# Altium project Remote_Sensor_Unit-v1.1.PrjPcb (part 1 of 4)
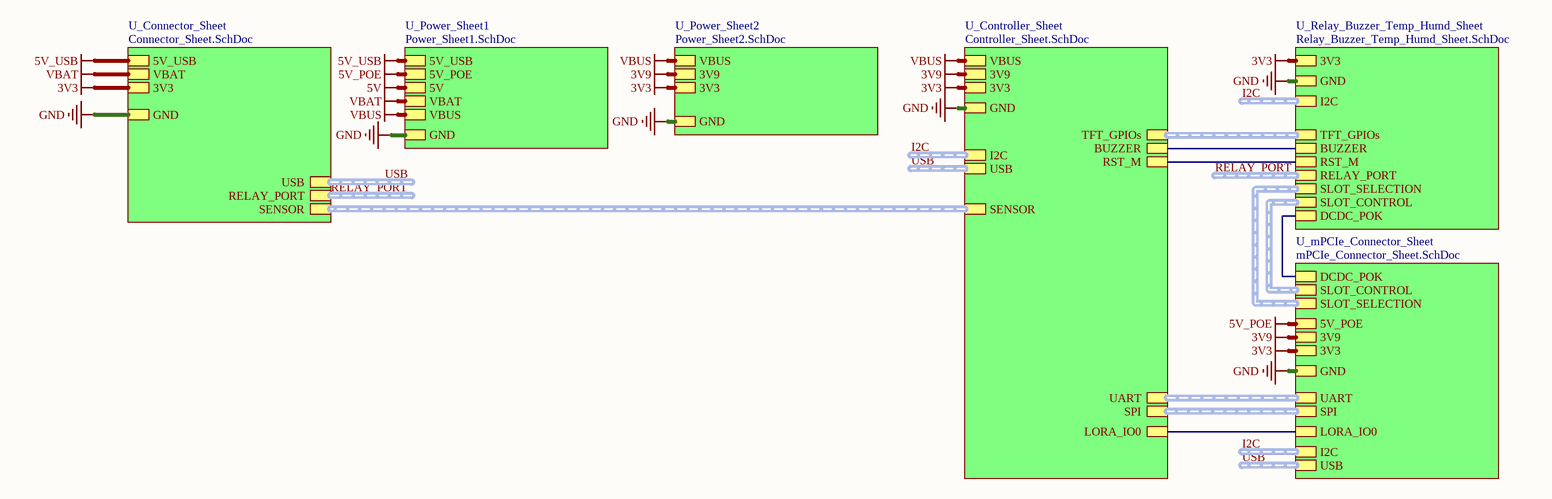
[diagram p0: Top_Sheet.SchDoc]
7 sheets, 164 parts. Net scope: hierarchical (ports join the sheet entries above them; power ports are global).
Board file: RemoteSensorUnit-v1.0.PcbDoc
Sheets:
  Top_Sheet.SchDoc
    U_Connector_Sheet = Connector_Sheet.SchDoc
    U_Power_Sheet1 = Power_Sheet1.SchDoc
    U_Power_Sheet2 = Power_Sheet2.SchDoc
    U_mPCIe_Connector_Sheet = mPCIe_Connector_Sheet.SchDoc
    U_Relay_Buzzer_Temp_Humd_Sheet = Relay_Buzzer_Temp_Humd_Sheet.SchDoc
    U_Controller_Sheet = Controller_Sheet.SchDoc

## Sheet Top_Sheet.SchDoc
size A4; SheetNumber: 1; SheetTotal: 7

### Sub-sheets
U_Connector_Sheet = Connector_Sheet.SchDoc: 5V_USB, 3V3, RELAY_PORT (harness RELAY_PORT), GND, SENSOR (harness SENSOR), USB (harness USB), VBAT
U_Controller_Sheet = Controller_Sheet.SchDoc: GND, 3V3, 3V9, VBUS, LORA_IO0, UART (harness UART), SPI (harness SPI), I2C (harness I2C), SENSOR (harness SENSOR), RST_M, USB (harness USB), BUZZER, TFT_GPIOs (harness I2C)
U_mPCIe_Connector_Sheet = mPCIe_Connector_Sheet.SchDoc: DCDC_POK, 5V_POE, 3V3, 3V9, GND, USB (harness USB), LORA_IO0, SLOT_SELECTION (harness SLOT_SELECTION), SLOT_CONTROL (harness SLOT_CONTROL), UART (harness UART), SPI (harness SPI), I2C (harness I2C)
U_Power_Sheet1 = Power_Sheet1.SchDoc: GND, VBUS, 5V_USB, VBAT, 5V_POE, 5V
U_Power_Sheet2 = Power_Sheet2.SchDoc: VBUS, 3V9, 3V3, GND
U_Relay_Buzzer_Temp_Humd_Sheet = Relay_Buzzer_Temp_Humd_Sheet.SchDoc: RELAY_PORT (harness RELAY_PORT), 3V3, GND, BUZZER, DCDC_POK, RST_M, SLOT_SELECTION (harness SLOT_SELECTION), SLOT_CONTROL (harness SLOT_CONTROL), I2C (harness I2C), TFT_GPIOs (harness I2C)

### Nets
3V3: sheet U_Connector_Sheet/3V3, sheet U_Power_Sheet2/3V3, sheet U_mPCIe_Connector_Sheet/3V3, sheet U_Relay_Buzzer_Temp_Humd_Sheet/3V3, sheet U_Controller_Sheet/3V3
3V9: sheet U_Power_Sheet2/3V9, sheet U_mPCIe_Connector_Sheet/3V9, sheet U_Controller_Sheet/3V9
5V_POE: sheet U_Power_Sheet1/5V_POE, sheet U_mPCIe_Connector_Sheet/5V_POE
5V_USB: sheet U_Connector_Sheet/5V_USB, sheet U_Power_Sheet1/5V_USB
GND: sheet U_Connector_Sheet/GND, sheet U_Power_Sheet1/GND, sheet U_Power_Sheet2/GND, sheet U_mPCIe_Connector_Sheet/GND, sheet U_Relay_Buzzer_Temp_Humd_Sheet/GND, sheet U_Controller_Sheet/GND
VBAT: sheet U_Connector_Sheet/VBAT, sheet U_Power_Sheet1/VBAT
VBUS: sheet U_Power_Sheet1/VBUS, sheet U_Power_Sheet2/VBUS, sheet U_Controller_Sheet/VBUS
BUZZER: sheet U_Relay_Buzzer_Temp_Humd_Sheet/BUZZER, sheet U_Controller_Sheet/BUZZER
DCDC_POK: sheet U_mPCIe_Connector_Sheet/DCDC_POK, sheet U_Relay_Buzzer_Temp_Humd_Sheet/DCDC_POK
LORA_IO0: sheet U_mPCIe_Connector_Sheet/LORA_IO0, sheet U_Controller_Sheet/LORA_IO0
RST_M: sheet U_Relay_Buzzer_Temp_Humd_Sheet/RST_M, sheet U_Controller_Sheet/RST_M

### Buses and harness runs
harness I2C = sheet U_Controller_Sheet/I2C
harness I2C = sheet U_mPCIe_Connector_Sheet/I2C
harness I2C = sheet U_Relay_Buzzer_Temp_Humd_Sheet/I2C
harness RELAY_PORT = sheet U_Connector_Sheet/RELAY_PORT
harness RELAY_PORT = sheet U_Relay_Buzzer_Temp_Humd_Sheet/RELAY_PORT
harness sheet U_Connector_Sheet/SENSOR = sheet U_Controller_Sheet/SENSOR
harness sheet U_Controller_Sheet/SPI = sheet U_mPCIe_Connector_Sheet/SPI
harness sheet U_Controller_Sheet/TFT_GPIOs = sheet U_Relay_Buzzer_Temp_Humd_Sheet/TFT_GPIOs
harness sheet U_Controller_Sheet/UART = sheet U_mPCIe_Connector_Sheet/UART
harness sheet U_mPCIe_Connector_Sheet/SLOT_CONTROL = sheet U_Relay_Buzzer_Temp_Humd_Sheet/SLOT_CONTROL
harness sheet U_mPCIe_Connector_Sheet/SLOT_SELECTION = sheet U_Relay_Buzzer_Temp_Humd_Sheet/SLOT_SELECTION
harness USB = sheet U_Connector_Sheet/USB
harness USB = sheet U_Controller_Sheet/USB
harness USB = sheet U_mPCIe_Connector_Sheet/USB

### Notes on the sheet
- File:
- Title:
- Date:
- Page
- Num:
- Total:
- Drawn By: Huzaifa Ali

## Sheet Connector_Sheet.SchDoc
size A4; SheetNumber: 2; SheetTotal: 7
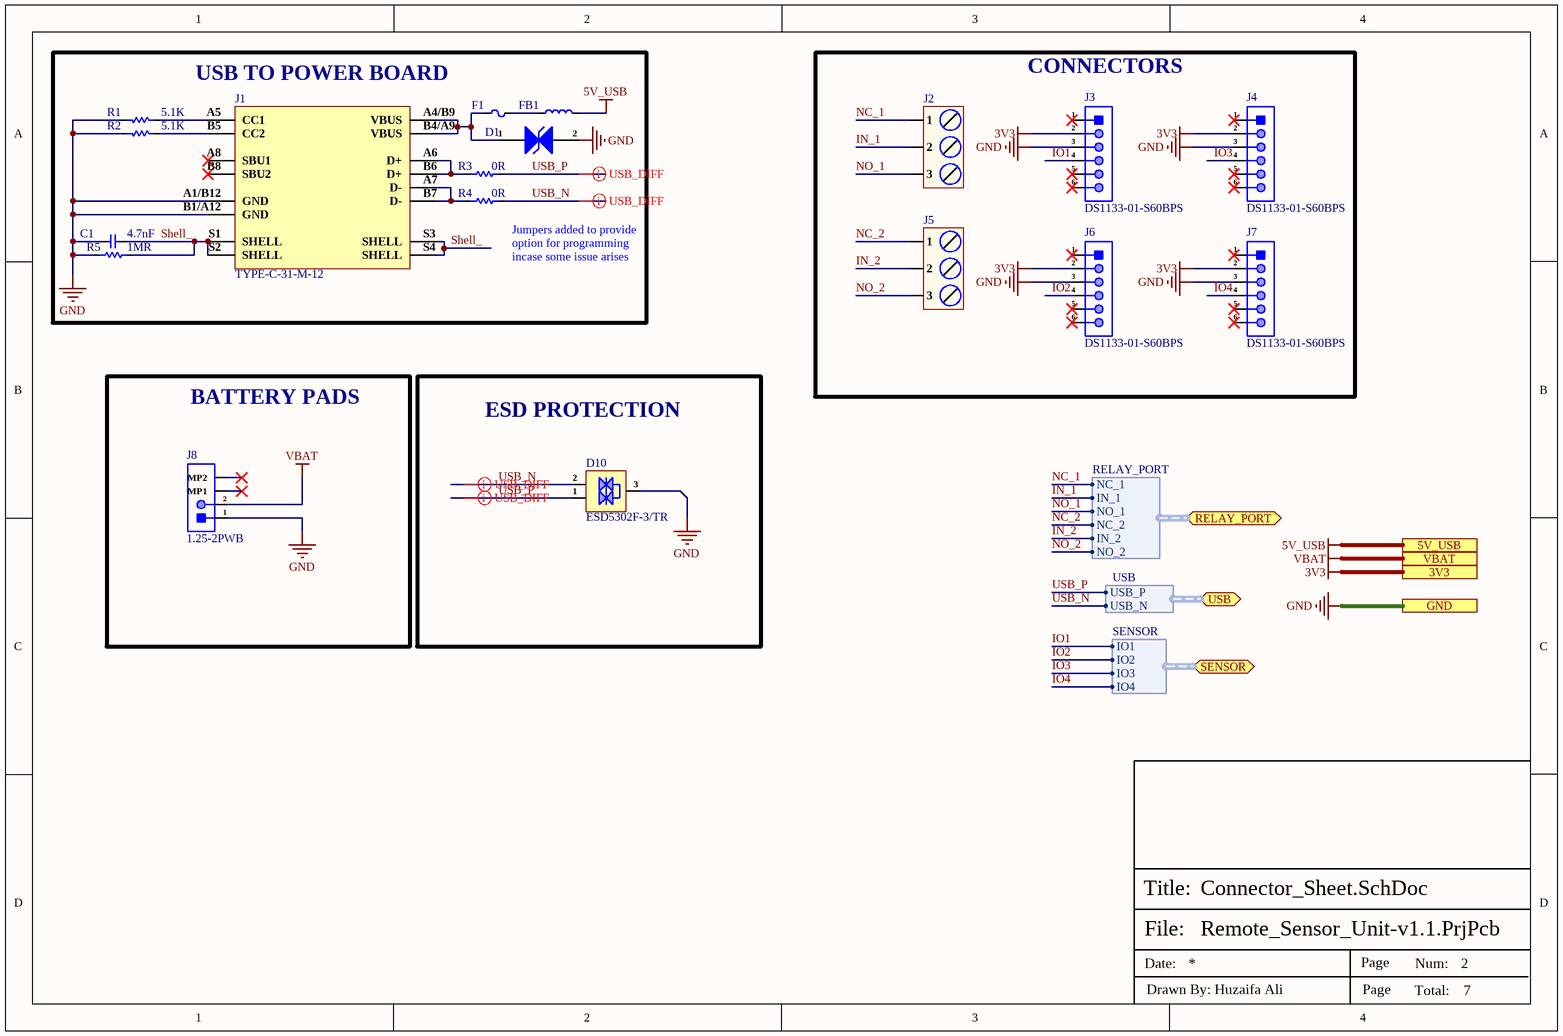
[diagram p1: Connector_Sheet.SchDoc]

### Parts
C1  4.7nF  [Cap-0603]
D1  PESD5V0H1BSFYL  [DSN0603-2]  (value not drawn)
D10  ESD5302F-3/TR  [Sot-23]
F1  1206L300SLTHYR  [Fuse 1206 (3216 Metric)]  (value not drawn)
FB1  100MHz  [IND-1206]  (value not drawn)
J1  TYPE-C-31-M-12  [TYPE-C-31-M-12_]
J2  DB128L-5.08-3P-BK-S  [DB128L-5.08-3P-BK-S]  (value not drawn)
J3  DS1133-01-S60BPS  [DS1133-01-S60BPS]
J4  DS1133-01-S60BPS  [DS1133-01-S60BPS]
J5  DB128L-5.08-3P-BK-S  [DB128L-5.08-3P-BK-S]  (value not drawn)
J6  DS1133-01-S60BPS  [DS1133-01-S60BPS]
J7  DS1133-01-S60BPS  [DS1133-01-S60BPS]
J8  1.25-2PWB  [1.25-2PWB]
R1  5.1K  [Res-0402]
R2  5.1K  [Res-0402]
R3  0R  [Res-0402]
R4  0R  [Res-0402]
R5  1MR  [Res-0402]

### Blocks framed on the sheet
USB TO POWER BOARD: C1 D1 F1 FB1 J1 R1-R5
CONNECTORS: J2-J7
BATTERY PADS: J8
ESD PROTECTION: D10

### Ports
3V3, 5V_USB, GND, RELAY_PORT (bidir, harness RELAY_PORT), SENSOR (bidir, harness SENSOR), USB (bidir, harness USB), VBAT

### Harnesses
RELAY_PORT: NC_2, NC_1, NO_2, NO_1, IN_2, IN_1
SENSOR: IO1, IO3, IO2, IO4
USB: USB_P, USB_N

### Nets
3V3: J3.2 J4.2 J6.2 J7.2 ; port 3V3
5V_USB: FB1.2 ; port 5V_USB
GND: C1.1 D1.2 D10.3(GND) J1.A1/B12(GND) J1.B1/A12(GND) J3.3 J4.3 J6.3 J7.3 J8.1 R1.2 R2.2 R5.2 ; port GND
VBAT: J8.2 ; port VBAT
IN_1: J2.2 ; port RELAY_PORT.IN_1
IN_2: J5.2 ; port RELAY_PORT.IN_2
IO1: J3.4 ; port SENSOR.IO1
IO2: J6.4 ; port SENSOR.IO2
IO3: J4.4 ; port SENSOR.IO3
IO4: J7.4 ; port SENSOR.IO4
NC_1: J2.1 ; port RELAY_PORT.NC_1
NC_2: J5.1 ; port RELAY_PORT.NC_2
NO_1: J2.3 ; port RELAY_PORT.NO_1
NO_2: J5.3 ; port RELAY_PORT.NO_2
Shell_: C1.2 J1.S1(SHELL) J1.S2(SHELL) J1.S3(SHELL) J1.S4(SHELL) R5.1
USB_N: D10.2(I/O2) R4.2 ; port USB.USB_N  [project net USB.USB_N]
USB_P: D10.1(I/O1) R3.2 ; port USB.USB_P  [project net USB.USB_P]
NetD1_1: D1.1 F1.1 J1.A4/B9(VBUS) J1.B4/A9(VBUS)
NetF1_2: F1.2 FB1.1
NetJ1_A5: J1.A5(CC1) R1.1
NetJ1_A6: J1.A6(D+) J1.B6(D+) R3.1
NetJ1_A7: J1.A7(D-) J1.B7(D-) R4.1
NetJ1_B5: J1.B5(CC2) R2.1

Not connected (* = marked no-connect by the designer): J1 A8(SBU1)* B8(SBU2)*; J3 1* 5* 6*; J4 1* 5* 6*; J6 1* 5* 6*; J7 1* 5* 6*; J8 MP1* MP2*

### Layout directives
differential pair; net class USB_DIFF; differential pair class USB_DIFF_Lines; rule Matched Net Lengths [Tolerance = 20mil]; rule Impedance Constraint [Min = 85.00    Max = 95.00    ]: USB.USB_N, USB.USB_P

### Notes on the sheet
- (near R4) Jumpers added to provide option for programming incase some issue arises
- File:
- Title:
- Date:
- Page
- Num:
- Total:
- Drawn By: Huzaifa Ali

### Library data of the parts
C1 = CC0603JRNPO9BN472: CAP CER 4700PF 50V C0G/NPO 0603; Manufacturer: Yageo; Item Type: Capacitor; Supplier 1: Digi-Key; Manufacturer Part Number: CC0603JRNPO9BN472; RoHS: Yes; Category: Ceramic Capacitors; Stock 1: 31779; Pricing 1: 1=0.48000, 10=0.33000, 50=0.23100, 100=0.19800, 500=0.14854, 1000=0.12543 (USD); RoHS Compliant: Yes; Supplier Part Number 1: 13-CC0603JRNPO9BN472CT-ND; LCSC Part Number: C576818; ComponentLink1Description: LCSC; ComponentLink1URL: https://www.lcsc.com/product-detail/Multilayer-Ceramic-Capacitors-MLCC-SMD-SMT_YAGEO-CC0603JRNPO9BN472_C576818.html
D1 = PESD5V0H1BSFYL: TVS DIODE 5VWM 6.3VC DSN0603-2; Manufacturer: Nexperia; Supplier 1: Avnet; Manufacturer Part Number: PESD5V0H1BSFYL; RoHS: Yes; Category: ESD and Circuit Protection ICs; Stock 1: 9000; Pricing 1: 18000=0.06453, 36000=0.06278, 54000=0.06104, 90000=0.05930, 180000=0.05755, 900000=0.05581, 1800000=0.05406 (USD); RoHS Compliant: Yes; ComponentLink1URL: http://www.farnell.com/datasheets/1961312.pdf?src-supplier=Farnell; ComponentLink1Description: http://www.farnell.com/datasheets/1961312.pdf?src-supplier=Farnell; ComponentLink2URL: https://assets.nexperia.com/documents/data-sheet/PESD5V0H1BSF.pdf?src-supplier=Digi-Key; ComponentLink2Description: https://assets.nexperia.com/documents/data-sheet/PESD5V0H1BSF.pdf?src-supplier=Digi-Key; ComponentLink3URL: http://www.farnell.com/datasheets/1961312.pdf?src-supplier=Newark; ComponentLink3Description: http://www.farnell.com/datasheets/1961312.pdf?src-supplier=Newark; Supplier Part Number 1: PESD5V0H1BSFYL; LCSC Part Number: C477989; Item Type: Diode
D10 = ESD5302F-3/TR: 16A 20V 7V 5V@Max Unidirectional SOT-23 TVS ROHS; Manufacturer: WILLSEMI; Item Type: Diode; Manufacturer Part Number: ESD5302F-3/TR; Package: SOT-23; LCSC Part Number: C239643; ComponentLink1Description: LCSC; ComponentLink1URL: https://www.lcsc.com/product-detail/TVS_WILLSEMI-Will-Semicon-ESD5302F-3-TR_C239643.html
F1 = 1206L300SLTHYR: PTC RESET FUSE 6V 3A 1206; Manufacturer: Littelfuse; Max Current Rating: 50A; Resistance: 20mR; Power Dissipation: 800mW; Trip Current: 6A; Time to Trip: 4s; Approvals: UL,TUV; Supplier 1: Arrow Electronics; Manufacturer Part Number: 1206L300SLTHYR; RoHS: Yes; Category: PTC Resettable Fuses; Stock 1: 4000; Pricing 1: 4000=0.60290 (USD); Case/Package: 1206; Case Code (Metric): 3216; Case Code (Imperial): 1206; Min Operating Temperature: -40°C; Max Operating Temperature: 85°C; Package Quantity: 4000; Packaging: Tape and Reel; Termination: SMD/SMT; Max Voltage Rating (DC): 6V; Hold Current: 3A; Voltage Rating (DC): 6V; Operating Supply Voltage: 6V; Series: POLY-FUSE®, LoRho™; Lead Free: Lead Free; RoHS Compliant: Yes; ComponentLink1URL: https://datasheet.ciiva.com/7438/littelfuse-lorho-ptc-7438567.pdf?src-supplier=Digi-Key; ComponentLink1Description: https://datasheet.ciiva.com/7438/littelfuse-lorho-ptc-7438567.pdf?src-supplier=Digi-Key; ComponentLink2URL: https://datasheet.ciiva.com/7438/littelfuse-lorho-ptc-7438569.pdf?src-supplier=Digi-Key; ComponentLink2Description: https://datasheet.ciiva.com/7438/littelfuse-lorho-ptc-7438569.pdf?src-supplier=Digi-Key; ComponentLink3URL: https://datasheet.ciiva.com/7438/littelfuse-lorho-ptc-7438565.pdf?src-supplier=Digi-Key; ComponentLink3Description: https://datasheet.ciiva.com/7438/littelfuse-lorho-ptc-7438565.pdf?src-supplier=Digi-Key; Supplier Part Number 1: 1206L300SLTHYR; LCSC Part Number: C207041; Item Type: Fuse
FB1 = BLM31PG121SN1L: FERRITE BEAD 120 OHM 1206 1LN; Manufacturer: Murata; Material: Steel,Ferrite; Tolerance: 25%; Impedance: 120R; Max Current Rating: 3.5A; Number of Lines: 1; DC Resistance (DCR): 20mR; Max DC Current: 3A; Shielding: Unshielded; Supplier 1: Avnet; Manufacturer Part Number: BLM31PG121SN1L; RoHS: Yes; Category: Ferrite Beads and Chips; Stock 1: 290640; Pricing 1: 3000=0.11563, 6000=0.10938, 12000=0.10313, 18000=0.09688, 24000=0.09063, 30000=0.08438, 300000=0.07813 (USD); Case/Package: 1206; Number of Pins: 2; Core Material: Ferrite; Case Code (Metric): 3216; Case Code (Imperial): 1206; Contact Plating: Tin,Matte; Min Operating Temperature: -55°C; Max Operating Temperature: 125°C; Package Quantity: 3000; Packaging: Tape and Reel; Current Rating: 3.5A; Termination: SMD/SMT; Test Frequency: 100MHz; DC Current: 3A; Frequency: 100MHz; Length: 3.2mm; Width: 1.6mm; Height: 1.1mm; Depth: 1.6mm; Radiation Hardening: No; Military Standard: Not; Lead Free: Lead Free; RoHS Compliant: Yes; ComponentLink1URL: https://datasheet.ciiva.com/19460/1845419-19460234.pdf?src-supplier=Jameco; ComponentLink1Description: https://datasheet.ciiva.com/19460/1845419-19460234.pdf?src-supplier=Jameco; ComponentLink2URL: https://datasheet.ciiva.com/1012/l0132s0193blm31p-1012992.pdf?src-supplier=Digi-Key; ComponentLink2Description: https://datasheet.ciiva.com/1012/l0132s0193blm31p-1012992.pdf?src-supplier=Digi-Key; ComponentLink3URL: https://datasheet.ciiva.com/11799/0900766b811b5866-11799444.pdf?src-supplier=RSComponents; ComponentLink3Description: https://datasheet.ciiva.com/11799/0900766b811b5866-11799444.pdf?src-supplier=RSComponents; ComponentLink4URL: https://datasheet.ciiva.com/3081/l0110s0100blm31p-3081665.pdf?src-supplier=Avnet; ComponentLink4Description: https://datasheet.ciiva.com/3081/l0110s0100blm31p-3081665.pdf?src-supplier=Avnet; ComponentLink5URL: https://datasheet.ciiva.com/41449/001172383-da-01-en-drossel-1206-120r-3-2x1-60mm-3000st-41449554.pdf?src-supplier=Conrad; ComponentLink5Description: https://datasheet.ciiva.com/41449/001172383-da-01-en-drossel-1206-120r-3-2x1-60mm-3000st-41449554.pdf?src-supplier=Conrad; ComponentLink6URL: https://datasheet.ciiva.com/29348/442557-da-01-en-chip-drossel-1206-120r-3000ma-3-2x1-60mm-29348014.pdf?src-supplier=Conrad; ComponentLink6Description: https://datasheet.ciiva.com/29348/442557-da-01-en-chip-drossel-1206-120r-3000ma-3-2x1-60mm-29348014.pdf?src-supplier=Conrad; ComponentLink7URL: https://datasheet.ciiva.com/14122/apblm31p-data-e-14122856.pdf?src-supplier=Distrelec; ComponentLink7Description: https://datasheet.ciiva.com/14122/apblm31p-data-e-14122856.pdf?src-supplier=Distrelec; ComponentLink8URL: https://datasheet.ciiva.com/48436/blm31pg121sn1l-eng-tds-48436731.pdf?src-supplier=Distrelec; ComponentLink8Description: https://datasheet.ciiva.com/48436/blm31pg121sn1l-eng-tds-48436731.pdf?src-supplier=Distrelec; ComponentLink9URL: https://datasheet.ciiva.com/1012/l0110s0100blm31p-1012991.pdf?src-supplier=Digi-Key; ComponentLink9Description: https://datasheet.ciiva.com/1012/l0110s0100blm31p-1012991.pdf?src-supplier=Digi-Key; ComponentLink10URL: https://datasheet.ciiva.com/1012/l0110s0100blm31p-1012993.pdf?src-supplier=Digi-Key; ComponentLink10Description: https://datasheet.ciiva.com/1012/l0110s0100blm31p-1012993.pdf?src-supplier=Digi-Key; ComponentLink11URL: https://datasheet.ciiva.com/3081/l0110s0100blm31p-3081666.pdf?src-supplier=Avnet; ComponentLink11Description: https://datasheet.ciiva.com/3081/l0110s0100blm31p-3081666.pdf?src-supplier=Avnet; ComponentLink12URL: https://datasheet.ciiva.com/16390/l0110s0100blm31p-16390857.pdf?src-supplier=Future+Electronics; ComponentLink12Description: https://datasheet.ciiva.com/16390/l0110s0100blm31p-16390857.pdf?src-supplier=Future+Electronics; ComponentLink13URL: https://datasheet.ciiva.com/18093/getdatasheetpartid-152966-18093084.pdf?src-supplier=Verical; ComponentLink13Description: https://datasheet.ciiva.com/18093/getdatasheetpartid-152966-18093084.pdf?src-supplier=Verical; Supplier Part Number 1: BLM31PG121SN1L; LCSC Part Number: C85841; Item Type: Ferrite Bead
J1 = TYPE-C-31-M-12: 250mA 1 16 Female Type-C SMD USB Connectors ROHS; Manufacturer: Korean Hroparts Elec; ComponentLink1Description: LCSC; ComponentLink1URL: https://www.lcsc.com/product-detail/USB-Connectors_Korean-Hroparts-Elec-TYPE-C-31-M-12_C165948.html; Manufacturer Part Number: TYPE-C-31-M-12; Footprint: Custom; LCSC Part Number: C165948; Item Type: USB Connector
J2 J5 = DB128L-5.08-3P-BK-S: 1x3P 18A -40℃~+105℃ 250V Black 12~30 Straight pin 5.08mm 2.5 1 3 Plugin,P=5.08mm Screw terminal ROHS; Manufacturer: DIBO; Item Type: Terminal Block; Manufacturer Part Number: DB128L-5.08-3P-BK-S; Package: Plugin,P=5.08mm; LCSC Part Number: C430602; ComponentLink1Description: LCSC; ComponentLink1URL: https://www.lcsc.com/product-detail/Screw-terminal_DIBO-DB128L-5-08-3P-BK-S_C430602.html
J3 J4 J6 J7 = DS1133-01-S60BPS: RJ11 RJReceptacle No 1 Plugin Ethernet Connectors/Modular Connectors (RJ45 RJ11) ROHS; Manufacturer: CONNFLY Elec; Item Type: RJ11 Ethernet Connector; Manufacturer Part Number: DS1133-01-S60BPS; Package: Custom; LCSC Part Number: C77854; ComponentLink1Description: LCSC; ComponentLink1URL: https://www.lcsc.com/product-detail/Ethernet-Connectors-Modular-Connectors-RJ45-RJ11_CONNFLY-Elec-DS1133-01-S60BPS_C77854.html
J8 = 1.25-2PWB: 1x2P 1 1.25mm Male pin 2 -40℃~+85℃ Surface Mount SMD,P=1.25mm Wire To Board / Wire To Wire Connector ROHS; Manufacturer: DEALON; Item Type: JST Connector; Manufacturer Part Number: 1.25-2PWB; Package: SMD,P=1.25mm; LCSC Part Number: C2905009; ComponentLink1Description: LCSC; ComponentLink1URL: https://www.lcsc.com/product-detail/Wire-To-Board-Wire-To-Wire-Connector_DEALON-1-25-2PWB_C2905009.html
R1 R2 = ERJ-PA2F5101X: RES SMD 5.1 KOHM 1% 1/5W 0402; Manufacturer: Panasonic; Item Type: Resistor; Supplier 1: Digi-Key; Manufacturer Part Number: ERJ-PA2F5101X; Stock 1: 5235; Pricing 1: 1=0.22, 10=0.183, 100=0.0717, 1000=0.03002, 2500=0.02751, 5000=0.02501 (USD); Supplier Part Number 1: P124488DKR-ND; LCSC Part Number: *
R3 R4 = RC0402FR-070RL: RES 0 OHM JUMPER 1/16W 0402; Manufacturer: Yageo; Tolerance: 1%; Power Rating: 62.5mW; Voltage Rating: 50V; Temperature Coefficient: 200ppm/°C; Max Power Dissipation: 63mW; Supplier 1: Mouser; Manufacturer Part Number: RC0402FR-070RL; RoHS: Yes; Category: Chip SMD Resistors; Stock 1: 8556842; Pricing 1: 1=0.10000, 10=0.01400, 50=0.01400, 100=0.00600, 1000=0.00300, 5000=0.00200, 10000=0.00100 (USD); Mount: Surface Mount; Case/Package: 0402; Contact Plating: Tin,Matte; Case Code (Imperial): 0402; Case Code (Metric): 1005; Size Code: 0402; Min Operating Temperature: -55°C; Max Operating Temperature: 155°C; Resistance: 0R; Resistor Type: Thick Film; Packaging: Tape and Reel; Termination: SMD/SMT; Features: Moisture Resistant; Series: RC; Number of Terminations: 2; Length: 1mm; Width: 0.5mm; Height: 0.35mm; Radiation Hardening: No; Lead Free: Lead Free; RoHS Compliant: Yes; ComponentLink1URL: https://datasheet.ciiva.com/8896/pyu-rc0402-51-rohs-l-6-8896149.pdf?src-supplier=Avnet; ComponentLink1Description: https://datasheet.ciiva.com/8896/pyu-rc0402-51-rohs-l-6-8896149.pdf?src-supplier=Avnet; ComponentLink2URL: https://datasheet.ciiva.com/16790/pyu-rc0402-51-rohs-l-6-r-16790444.pdf?src-supplier=Future+Electronics; ComponentLink2Description: https://datasheet.ciiva.com/16790/pyu-rc0402-51-rohs-l-6-r-16790444.pdf?src-supplier=Future+Electronics; Supplier Part Number 1: 603-RC0402FR-070RL; LCSC Part Number: C106231
R5 = MCS0402MD1004BE000: RES 1M OHM 0.1% 1/16W 0402; Manufacturer: Vishay BCcomponents; Item Type: Resistor; Supplier: Mouser; Supplier Part Number: 594-MCS0402MD1004BE0; Manufacturer Part Number: MCS0402MD1004BE000; RoHS: Yes; Category: Chip SMD Resistors; Stock: 33788; Pricing: 1=0.56, 10=0.293, 50=0.293, 100=0.16, 1000=0.121, 10000=0.117 (USD); LCSC Part Number: C4334825